# Altium schematic sheet Connector_Sheet.SchDoc
size 420 x 297 mm; SheetNumber: 4; SheetTotal: 4
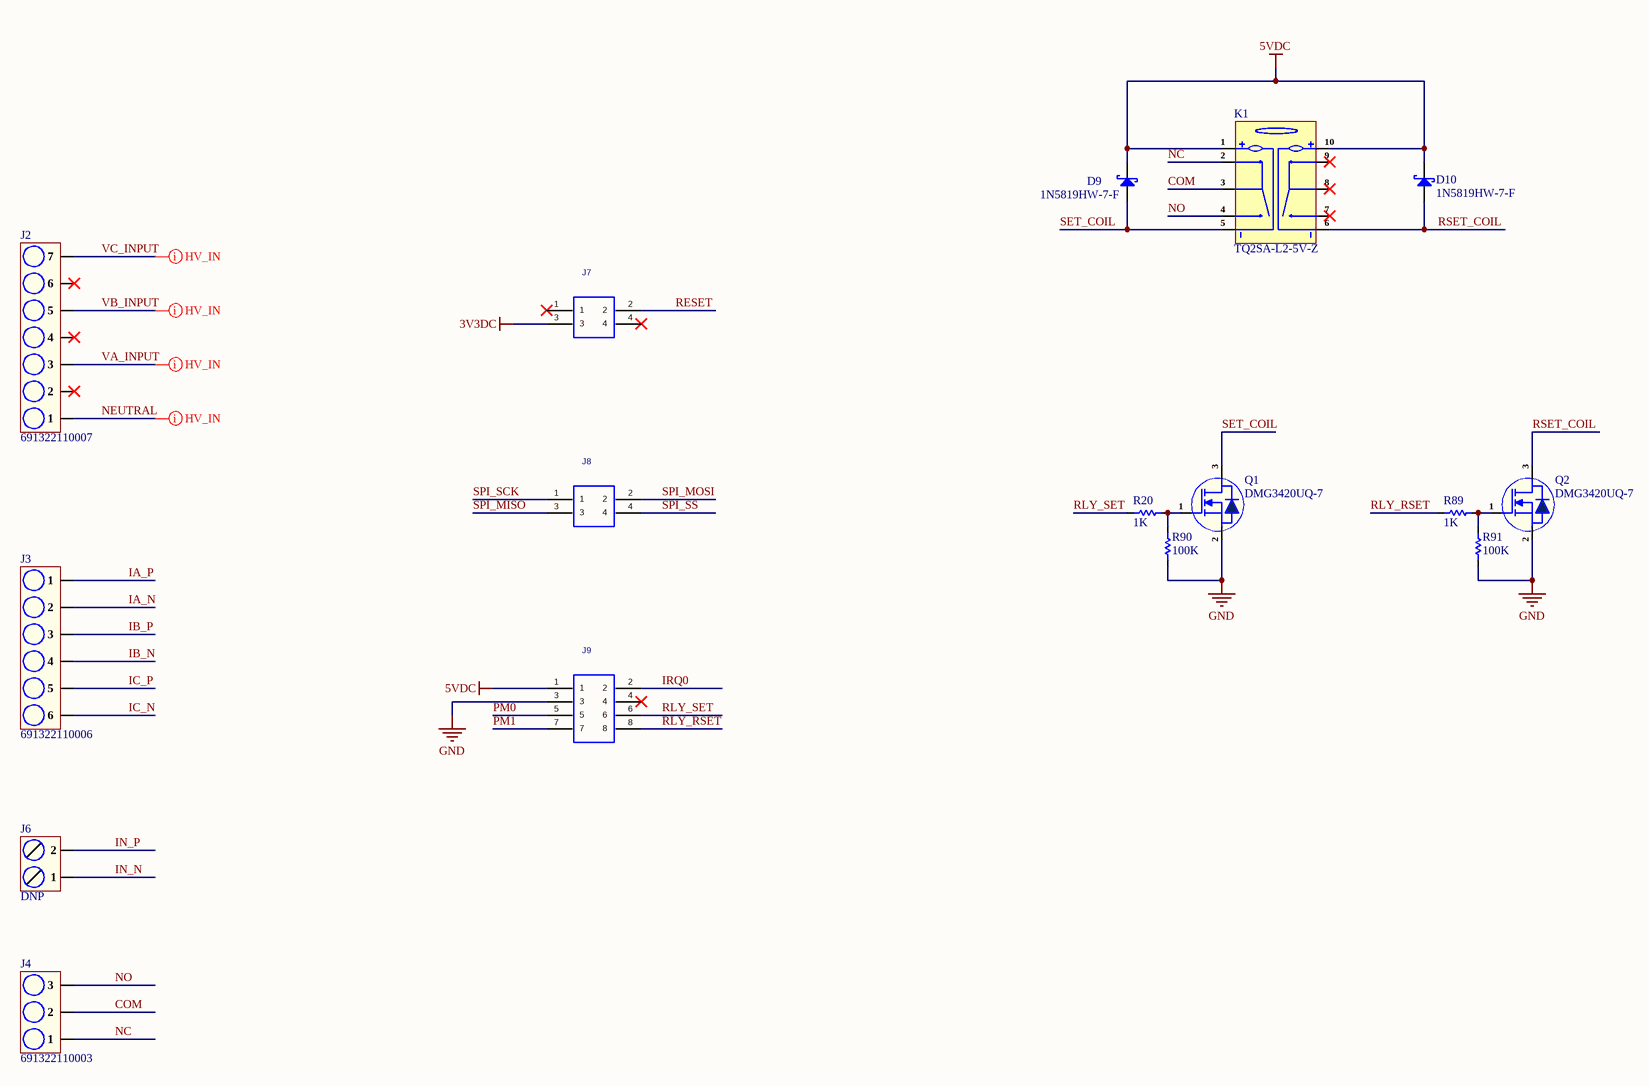
[diagram p0: Connector_Sheet.SchDoc]

## Parts
D9  1N5819HW-7-F  [SOD-123]
D10  1N5819HW-7-F  [SOD-123]
J2  691322110007  [691322110007]
J3  691322110006  [691322110006]
J4  691322110003  [691322110003]
J6  DNP  [TBP01R1-508-02BE]
J7  SFMC-102-X1-XX-D  [SFMC-102-X1-XX-D - 570]  (value not drawn)
J8  SFMC-102-X1-XX-D  [SFMC-102-X1-XX-D - 570]  (value not drawn)
J9  SFMC-104-X1-XX-D  [SFMC-104-X1-XX-D - 570]  (value not drawn)
K1  TQ2SA-L2-5V-Z  [TQ2SA-L2-5V-Z]
Q1  DMG3420UQ-7  [SOT-23]
Q2  DMG3420UQ-7  [SOT-23]
R20  1K  [Res-0402]
R89  1K  [Res-0402]
R90  100K  [Res-0402]
R91  100K  [Res-0402]

## Nets
3V3DC: J7.3
5VDC: D9.2(K) D10.2(K) J9.1 K1.1 K1.10
GND: J9.3 Q1.2(S) Q2.2(S) R90.1 R91.1
COM: J4.2 K1.3
IA_N: J3.2
IA_P: J3.1
IB_N: J3.4
IB_P: J3.3
IC_N: J3.6
IC_P: J3.5
IN_N: J6.1
IN_P: J6.2
IRQ0: J9.2
NC: J4.1 K1.2
NEUTRAL: J2.1
NO: J4.3 K1.4
PM0: J9.5
PM1: J9.7
RESET: J7.2
RLY_RSET: J9.8 R89.1
RLY_SET: J9.6 R20.1
RSET_COIL: D10.1(A) K1.6 Q2.3(D)
SET_COIL: D9.1(A) K1.5 Q1.3(D)
SPI_MISO: J8.3
SPI_MOSI: J8.2
SPI_SCK: J8.1
SPI_SS: J8.4
VA_INPUT: J2.3
VB_INPUT: J2.5
VC_INPUT: J2.7
NetQ1_1: Q1.1(G) R20.2 R90.2
NetQ2_1: Q2.1(G) R89.2 R91.2

Not connected (* = marked no-connect by the designer): J2 2* 4* 6*; J7 1* 4*; J9 4*; K1 7* 8* 9*

## Layout directives
net class HV_IN; rule Clearance Constraint [Generic clearance = 1.5mm, and 10 value(s) for objects]: NEUTRAL, VA_INPUT, VB_INPUT, VC_INPUT

## Notes on the sheet
- File:
- Title:
- Date:
- Page
- Num:
- Total:
- Drawn By: Huzaifa Ali

## Library data of the parts
D9 D10 = 1N5819HW-7-F: DIODE SCHOTTKY 40V 1A SOD123; Manufacturer: Diodes; Forward Voltage: 450mV; Max Reverse Current: 50uA; Element Configuration: Single; Max Forward Surge Current (Ifsm): 25A; Max Power Dissipation: 450mW; Polarity: Standard; Capacitance: 110pF; Supplier 1: Digi-Key; Manufacturer Part Number: 1N5819HW-7-F; RoHS: Yes; Category: Schottky Diodes; Pricing 1: 1=0.46000, 10=0.34500, 100=0.19530, 500=0.12936, 1000=0.09918 (USD); Case/Package: SOD-123-2; Number of Pins: 2; Weight: 0.000353oz; Contact Plating: Tin,Matte; Min Operating Temperature: -65°C; Max Operating Temperature: 125°C; Forward Current: 1A; Max Repetitive Reverse Voltage (Vrrm): 40V; Packaging: Tape and Reel; Peak Non-Repetitive Surge Current: 25A; Package Quantity: 3000; Average Rectified Current: 1A; Termination: SMD/SMT; Voltage Rating (DC): 40V; Current Rating: 1A; Output Current: 1A; Max Reverse Voltage (DC): 40V; Series: -; Length: 2.85mm; Width: 1.7mm; Height: 1.25mm; Radiation Hardening: No; RoHS Compliant: Yes; REACH SVHC: No SVHC; Lead Free: Lead Free; ComponentLink1URL: https://datasheet.ciiva.com/16303/ds30217-16303296.pdf?src-supplier=Future+Electronics; ComponentLink1Description: https://datasheet.ciiva.com/16303/ds30217-16303296.pdf?src-supplier=Future+Electronics; ComponentLink2URL: https://datasheet.ciiva.com/27092/1538419-27092484.pdf?src-supplier=Jameco; ComponentLink2Description: https://datasheet.ciiva.com/27092/1538419-27092484.pdf?src-supplier=Jameco; ComponentLink3URL: https://datasheet.ciiva.com/912/ds30217-912801.pdf?src-supplier=Digi-Key; ComponentLink3Description: https://datasheet.ciiva.com/912/ds30217-912801.pdf?src-supplier=Digi-Key; ComponentLink4URL: https://datasheet.ciiva.com/1177/ds30217-1177089.pdf?src-supplier=Element14; ComponentLink4Description: https://datasheet.ciiva.com/1177/ds30217-1177089.pdf?src-supplier=Element14; ComponentLink5URL: https://datasheet.ciiva.com/912/ds30217-912802.pdf?src-supplier=Digi-Key; ComponentLink5Description: https://datasheet.ciiva.com/912/ds30217-912802.pdf?src-supplier=Digi-Key; ComponentLink6URL: https://datasheet.ciiva.com/912/ds30217-912803.pdf?src-supplier=Digi-Key; ComponentLink6Description: https://datasheet.ciiva.com/912/ds30217-912803.pdf?src-supplier=Digi-Key; ComponentLink7URL: https://datasheet.ciiva.com/8303/ds30217-8303132.pdf?src-supplier=Avnet; ComponentLink7Description: https://datasheet.ciiva.com/8303/ds30217-8303132.pdf?src-supplier=Avnet; ComponentLink8URL: https://datasheet.ciiva.com/25919/ds30217-25919644.pdf?src-supplier=Avnet+Europe; ComponentLink8Description: https://datasheet.ciiva.com/25919/ds30217-25919644.pdf?src-supplier=Avnet+Europe; Supplier Part Number 1: 1N5819HW-FDICT-ND; LCSC Part Number: C82544; Item Type: Diode
J2 = 691322110007: TERM BLOCK HDR 7POS 3.50MM; Manufacturer: Wurth Elektronik; Item Type: Terminal Blocks; Supplier: DigiKey; Manufacturer Part Number: 691322110007; Stock: 385; Pricing: 1=1.67, 10=1.517, 50=1.4248, 100=1.3032, 465=1.05841 (USD); ComponentLink1URL: https://datasheet.octopart.com:443/691322110007-Wurth-Elektronik-datasheet-111088189.pdf?src-supplier=RS+(Formerly+Allied+Electronics); ComponentLink1Description: https://datasheet.octopart.com:443/691322110007-Wurth-Elektronik-datasheet-111088189.pdf?src-supplier=RS+(Formerly+Allied+Electronics)
J3 = 691322110006: TERM BLOCK HDR 6POS 3.50MM; Manufacturer: Wurth Elektronik; Item Type: Terminal Blocks; Connector Type: PCB, Terminal Block; Current: 10A; Gender: Male; Number of Contacts: 6; Number of Levels: 1; Pitch: 3.5052mm; Voltage: 300V; Supplier: DigiKey; Supplier Part Number: 732-2773-ND; Manufacturer Part Number: 691322110006; RoHS: Compliant; Stock: 1584; Pricing: 1=1.19, 10=1.064, 50=0.9198, 100=0.8226, 250=0.77312, 560=0.7245 (USD); Color: Green; Contact Gender: Male; Contact Material: Brass; Height: 9.2mm; Lead Pitch: 3.5mm; Length: 10.5mm; Mounting Technology: Through Hole; Pins: 6; Number of Positions Per Level: 6; Number of Rows: 1; Packaging: Box; Termination: Solder; Width: 22.1mm; ComponentLink1URL: https://datasheet.octopart.com:443/691322110006-W%C3%BCrth-Elektronik-datasheet-111088189.pdf?src-supplier=Farnell; ComponentLink1Description: https://datasheet.octopart.com:443/691322110006-W%C3%BCrth-Elektronik-datasheet-111088189.pdf?src-supplier=Farnell; ComponentLink2URL: https://datasheet.octopart.com:443/691322110006-W%C3%BCrth-Elektronik-datasheet-12532410.pdf?src-supplier=Farnell; ComponentLink2Description: https://datasheet.octopart.com:443/691322110006-W%C3%BCrth-Elektronik-datasheet-12532410.pdf?src-supplier=Farnell; ComponentLink3URL: https://datasheet.octopart.com:443/691322110006-W%C3%BCrth-Elektronik-Midcom-datasheet-10414363.pdf?src-supplier=Farnell; ComponentLink3Description: https://datasheet.octopart.com:443/691322110006-W%C3%BCrth-Elektronik-Midcom-datasheet-10414363.pdf?src-supplier=Farnell; ComponentLink4URL: https://datasheet.octopart.com:443/691322110006-W%C3%BCrth-Elektronik-Midcom-datasheet-10405066.pdf?src-supplier=Newark; ComponentLink4Description: https://datasheet.octopart.com:443/691322110006-W%C3%BCrth-Elektronik-Midcom-datasheet-10405066.pdf?src-supplier=Newark
J4 = 691322110003: TERM BLOCK HDR 3POS 3.50MM; Manufacturer: Wurth Elektronik; Item Type: Terminal Blocks; Current: 10A; Gender: Male; Number of Contacts: 3; Number of Levels: 1; Pitch: 3.5052mm; Voltage: 300V; Supplier: DigiKey; Supplier Part Number: 732-2770-ND; Manufacturer Part Number: 691322110003; RoHS: Compliant; Stock: 11796; Pricing: 1=0.66, 10=0.591, 50=0.5112, 100=0.4572, 250=0.4302, 750=0.4032 (USD); Color: Green; Contact Material: Brass; Height: 9.2mm; Lead Pitch: 3.5mm; Length: 10.5mm; Mounting Technology: Through Hole; Pins: 3; Number of Positions Per Level: 3; Number of Rows: 1; Packaging: Box; Termination: Solder; Width: 11.6mm; ComponentLink1URL: https://datasheet.octopart.com:443/691322110003-W%C3%BCrth-Elektronik-datasheet-111088189.pdf?src-supplier=Future+Electronics; ComponentLink1Description: https://datasheet.octopart.com:443/691322110003-W%C3%BCrth-Elektronik-datasheet-111088189.pdf?src-supplier=Future+Electronics; ComponentLink2URL: https://datasheet.octopart.com:443/691322110003-W%C3%BCrth-Elektronik-datasheet-12532410.pdf?src-supplier=Farnell; ComponentLink2Description: https://datasheet.octopart.com:443/691322110003-W%C3%BCrth-Elektronik-datasheet-12532410.pdf?src-supplier=Farnell; ComponentLink3URL: https://datasheet.octopart.com:443/691322110003-W%C3%BCrth-Elektronik-Midcom-datasheet-10414363.pdf?src-supplier=Farnell; ComponentLink3Description: https://datasheet.octopart.com:443/691322110003-W%C3%BCrth-Elektronik-Midcom-datasheet-10414363.pdf?src-supplier=Farnell; ComponentLink4URL: https://datasheet.octopart.com:443/691322110003-W%C3%BCrth-Elektronik-Midcom-datasheet-10405066.pdf?src-supplier=Newark; ComponentLink4Description: https://datasheet.octopart.com:443/691322110003-W%C3%BCrth-Elektronik-Midcom-datasheet-10405066.pdf?src-supplier=Newark
J6 = TBP01R1-508-02BE: TERMINAL BLOCK, PLUGGABLE, 5.08,; Manufacturer: CUI Devices; Item Type: Terminal Blocks; Supplier 1: Arrow Electronics; Manufacturer Part Number: TBP01R1-508-02BE; RoHS: Yes; Stock 1: 1821; Pricing 1: 1=0.57450, 10=0.23530, 25=0.18730, 50=0.17170, 100=0.16040, 400=0.14010, 800=0.12060, 1200=0.11290 (USD); Supplier Part Number 1: TBP01R1-508-02BE
J7 J8 = SFMC-102-X1-XX-D: Socket Strip, Cuttable, Double Row, 0.050"x0.050" Pitch; MANUFACTURER: SAMTEC; PCB DECAL: FW-02-02-L-D-560-150; System: Connector; CREATED: JUNE 03,  2014 - WENDY XIN; Supplier 1: Samtec
J9 = SFMC-104-X1-XX-D: Socket Strip, Cuttable, Double Row, 0.050"x0.050" Pitch; MANUFACTURER: SAMTEC; PCB DECAL: FW-04-02-L-D-560-150; System: Connector; CREATED: JUNE 03,  2014 - WENDY XIN; Supplier 1: SAMTEC
K1 = TQ2SA-L2-5V-Z: RELAY TELECOM DPDT 500MA 5V; Manufacturer: Panasonic; Item Type: Signal Relays; Coil Current: 28mA; Coil Power: 140mW; Coil Resistance: 178Ω; Coil Type: Latching, Dual Coil; Coil Voltage (DC): 3.75V; Contact Current Rating: 2A; Contact Resistance: 75mΩ; Contact Voltage Rating (AC): 125V; Electrical Life: 100kcycles; Insertion Loss (dB): 0.8dB; Insulation Resistance: 1GΩ; Max Voltage Rating (DC): 220V; Number of Contacts: 2; Operate Time: 4ms; Supplier: Arrow Electronics; LCSC Part Number: C2684450; Manufacturer Part Number: TQ2SA-L2-5V-Z; RoHS: Compliant; Stock: 95; Pricing: 37=2.711 (USD); Ambient Temperature Range High: 85°C; Contact Material: Silver; Contact Plating: Gold; Current Rating: 2A; Depth: 11.5mm; Height: 5.4mm; Lead Free: Lead Free; Length: 14mm; Lifecycle Status: Production; Max Current Rating: 2A; Max Operating Temperature: 70°C; Max Voltage Rating (AC): 125V; Min Operating Temperature: -40°C; Mounting Technology: Surface Mount; Pins: 10; Number of Terminals: 10; Packaging: Tape and Reel; Power Consumption: 140mW; Radiation Hardening: No; REACH SVHC: Yes; Relay Type: Telecom; Release Time: 4ms; Response Time: 4ms; Switching Current: 2A; Termination: Gull Wing; Throw Configuration: DPDT; Voltage Rating (AC): 125V; Voltage Rating (DC): 220V; Weight: 2g; Width: 9mm; ComponentLink1URL: https://datasheet.octopart.com:443/TQ2SA-L2-5V-Z-Panasonic-datasheet-138897391.pdf?src-supplier=Sager+Electronics; ComponentLink1Description: https://datasheet.octopart.com:443/TQ2SA-L2-5V-Z-Panasonic-datasheet-138897391.pdf?src-supplier=Sager+Electronics; ComponentLink2URL: https://datasheet.octopart.com:443/TQ2SA-L2-5V-Z-Panasonic-datasheet-34148902.pdf?src-supplier=IHS; ComponentLink2Description: https://datasheet.octopart.com:443/TQ2SA-L2-5V-Z-Panasonic-datasheet-34148902.pdf?src-supplier=IHS; ComponentLink3URL: https://datasheet.octopart.com:443/TQ2SA-L2-5V-Z-Panasonic-datasheet-110367.pdf?src-supplier=element14; ComponentLink3Description: https://datasheet.octopart.com:443/TQ2SA-L2-5V-Z-Panasonic-datasheet-110367.pdf?src-supplier=element14; ComponentLink4URL: https://datasheet.octopart.com:443/TQ2SA-L2-5V-Z-Panasonic-datasheet-8361856.pdf?src-supplier=Panasonic; ComponentLink4Description: https://datasheet.octopart.com:443/TQ2SA-L2-5V-Z-Panasonic-datasheet-8361856.pdf?src-supplier=Panasonic; ComponentLink5URL: https://datasheet.octopart.com:443/TQ2SA-L2-5V-Z-Panasonic-datasheet-11522959.pdf?src-supplier=Panasonic; ComponentLink5Description: https://datasheet.octopart.com:443/TQ2SA-L2-5V-Z-Panasonic-datasheet-11522959.pdf?src-supplier=Panasonic; ComponentLink6URL: https://datasheet.octopart.com:443/TQ2SA-L2-5V-Z-Panasonic-datasheet-136735749.pdf?src-supplier=Electro+Sonic; ComponentLink6Description: https://datasheet.octopart.com:443/TQ2SA-L2-5V-Z-Panasonic-datasheet-136735749.pdf?src-supplier=Electro+Sonic; ComponentLink7URL: https://datasheet.octopart.com:443/TQ2SA-L2-5V-Z-Panasonic-datasheet-27895613.pdf?src-supplier=Electro+Sonic; ComponentLink7Description: https://datasheet.octopart.com:443/TQ2SA-L2-5V-Z-Panasonic-datasheet-27895613.pdf?src-supplier=Electro+Sonic; ComponentLink8URL: https://datasheet.octopart.com:443/TQ2SA-L2-5V-Z-Panasonic-EW-datasheet-23711783.pdf?src-supplier=Electro+Sonic; ComponentLink8Description: https://datasheet.octopart.com:443/TQ2SA-L2-5V-Z-Panasonic-EW-datasheet-23711783.pdf?src-supplier=Electro+Sonic; ComponentLink9URL: https://datasheet.octopart.com:443/TQ2SA-L2-5V-Z-Panasonic-datasheet-152536022.pdf?src-supplier=Master+Electronics; ComponentLink9Description: https://datasheet.octopart.com:443/TQ2SA-L2-5V-Z-Panasonic-datasheet-152536022.pdf?src-supplier=Master+Electronics; ComponentLink10URL: https://datasheet.octopart.com:443/TQ2SA-L2-5V-Z-Panasonic-datasheet-30321.pdf?src-supplier=DigiKey; ComponentLink10Description: https://datasheet.octopart.com:443/TQ2SA-L2-5V-Z-Panasonic-datasheet-30321.pdf?src-supplier=DigiKey; ComponentLink11URL: https://datasheet.octopart.com:443/TQ2SA-L2-5V-Z-Panasonic-datasheet-10222392.pdf?src-supplier=Future+Electronics; ComponentLink11Description: https://datasheet.octopart.com:443/TQ2SA-L2-5V-Z-Panasonic-datasheet-10222392.pdf?src-supplier=Future+Electronics
Q1 Q2 = DMG3420UQ-7: MOSFET BVDSS: 8V~24V SOT23 T&R 3; Manufacturer: Diodes; Item Type: MOSFETs; Supplier: Digikey; LCSC Part Number: C5157847; Manufacturer Part Number: DMG3420UQ-7; RoHS: Yes; Stock: 5879; Pricing: 1=0.45, 10=0.276, 100=0.1748, 500=0.1308, 1000=0.11658 (USD); RoHS Compliant: Yes
R20 R89 = RC0402FR-071KL: RES 1K OHM 1% 1/16W 0402; Manufacturer: Yageo; Resistance: 1kR; Temperature Coefficient: 100ppm/°C; Voltage Rating (DC): 50V; Power Rating: 62.5mW; Max Power Dissipation: 63mW; Item Type: Resistor; Supplier 1: Avnet; Manufacturer Part Number: RC0402FR-071KL; RoHS: Yes; Category: Chip SMD Resistors; Stock 1: 13030000; Pricing 1: 10000=0.00085, 20000=0.00087, 40000=0.00084, 60000=0.00083, 80000=0.00079, 100000=0.00078, 1000000=0.00076 (USD); Case/Package: 0402; Number of Pins: 2; Case Code (Imperial): 0402; Case Code (Metric): 1005; Size Code: 0402; Min Operating Temperature: -55°C; Max Operating Temperature: 155°C; Resistor Type: Thick Film; Tolerance: 1%; Packaging: Tape and Reel; Voltage Rating: 50V; Termination: SMD/SMT; Features: Moisture Resistant; Series: RC; Number of Terminations: 2; Resistance Tolerance: 1%; Construction: Rectangular; Technology: THICK FILM; Length: 1mm; Width: 0.5mm; Height: 0.32mm; Depth: 0.5mm; Reach SVHC Compliant: Yes; Lead Free: Lead Free; RoHS Compliant: Yes; Military Standard: Not; ComponentLink1URL: https://datasheet.ciiva.com/11819/0900766b80c66297-11819477.pdf?src-supplier=RSComponents; ComponentLink1Description: https://datasheet.ciiva.com/11819/0900766b80c66297-11819477.pdf?src-supplier=RSComponents; ComponentLink2URL: https://datasheet.ciiva.com/7983/1018594-7983502.pdf?src-supplier=Element14; ComponentLink2Description: https://datasheet.ciiva.com/7983/1018594-7983502.pdf?src-supplier=Element14; ComponentLink3URL: https://datasheet.ciiva.com/22747/1018594-22747513.pdf?src-supplier=Element14; ComponentLink3Description: https://datasheet.ciiva.com/22747/1018594-22747513.pdf?src-supplier=Element14; ComponentLink4URL: https://datasheet.ciiva.com/12666/pyu-rc0402-51-rohs-l-6-r-12666741.pdf?src-supplier=Mouser; ComponentLink4Description: https://datasheet.ciiva.com/12666/pyu-rc0402-51-rohs-l-6-r-12666741.pdf?src-supplier=Mouser; ComponentLink5URL: https://datasheet.ciiva.com/7849/1018594-7849869.pdf?src-supplier=Element14; ComponentLink5Description: https://datasheet.ciiva.com/7849/1018594-7849869.pdf?src-supplier=Element14; ComponentLink6URL: https://datasheet.ciiva.com/7849/1018594-7849871.pdf?src-supplier=Element14; ComponentLink6Description: https://datasheet.ciiva.com/7849/1018594-7849871.pdf?src-supplier=Element14; ComponentLink7URL: https://datasheet.ciiva.com/17063/pyu-rc0402-51-rohs-l-6-r-17063193.pdf?src-supplier=Future+Electronics; ComponentLink7Description: https://datasheet.ciiva.com/17063/pyu-rc0402-51-rohs-l-6-r-17063193.pdf?src-supplier=Future+Electronics; Supplier Part Number 1: RC0402FR-071KL; LCSC Part Number: C106235
R90 R91 = RC0402FR-07100KL: RES 100K OHM 1% 1/16W 0402; Manufacturer: Yageo; Resistance: 100kR; Temperature Coefficient: 100ppm/°C; Power Rating: 63mW; Voltage Rating: 50V; Item Type: Resistor; Supplier 1: Mouser; Manufacturer Part Number: RC0402FR-07100KL; RoHS: Yes; Category: Chip SMD Resistors; Stock 1: 7759549; Pricing 1: 1=0.10000, 10=0.01200, 50=0.01200, 100=0.00500, 1000=0.00300, 2500=0.00200, 10000=0.00100 (USD); Case/Package: 0402; Case Code (Metric): 1005; Case Code (Imperial): 0402; Min Operating Temperature: -55°C; Max Operating Temperature: 155°C; Resistor Type: Thick Film; Tolerance: 1%; Packaging: Tape and Reel; Package Quantity: 1; Number of Terminations: 2; Termination: SMD/SMT; Max Power Dissipation: 63mW; Working Voltage: 50V; Features: Moisture Resistant; Series: RC; Resistance Tolerance: 1%; Construction: Rectangular; Technology: THICK FILM; Length: 0.039inch; Width: 0.02inch; Height: 0.016inch; Depth: 0.5mm; REACH SVHC: No SVHC; Lead Free: Lead Free; RoHS Compliant: Yes; Military Standard: Not; ComponentLink1URL: https://datasheet.ciiva.com/11819/0900766b80c66297-11819452.pdf?src-supplier=RSComponents; ComponentLink1Description: https://datasheet.ciiva.com/11819/0900766b80c66297-11819452.pdf?src-supplier=RSComponents; ComponentLink2URL: https://datasheet.ciiva.com/22747/1018594-22747509.pdf?src-supplier=Element14; ComponentLink2Description: https://datasheet.ciiva.com/22747/1018594-22747509.pdf?src-supplier=Element14; ComponentLink3URL: https://datasheet.ciiva.com/2453/pyu-r-int-thick-7-2453362.pdf?src-supplier=Digi-Key; ComponentLink3Description: https://datasheet.ciiva.com/2453/pyu-r-int-thick-7-2453362.pdf?src-supplier=Digi-Key; ComponentLink4URL: https://datasheet.ciiva.com/2453/pyu-r-int-thick-7-2453363.pdf?src-supplier=Digi-Key; ComponentLink4Description: https://datasheet.ciiva.com/2453/pyu-r-int-thick-7-2453363.pdf?src-supplier=Digi-Key; ComponentLink5URL: https://datasheet.ciiva.com/2453/pyu-r-int-thick-7-2453361.pdf?src-supplier=Digi-Key; ComponentLink5Description: https://datasheet.ciiva.com/2453/pyu-r-int-thick-7-2453361.pdf?src-supplier=Digi-Key; ComponentLink6URL: https://datasheet.ciiva.com/12667/pyu-rc0402-51-rohs-l-6-r-12667930.pdf?src-supplier=Mouser; ComponentLink6Description: https://datasheet.ciiva.com/12667/pyu-rc0402-51-rohs-l-6-r-12667930.pdf?src-supplier=Mouser; ComponentLink7URL: https://datasheet.ciiva.com/15189/getdatasheetpartid-323696-15189334.pdf?src-supplier=Verical; ComponentLink7Description: https://datasheet.ciiva.com/15189/getdatasheetpartid-323696-15189334.pdf?src-supplier=Verical; Supplier Part Number 1: 603-RC0402FR-07100KL; LCSC Part Number: C60491